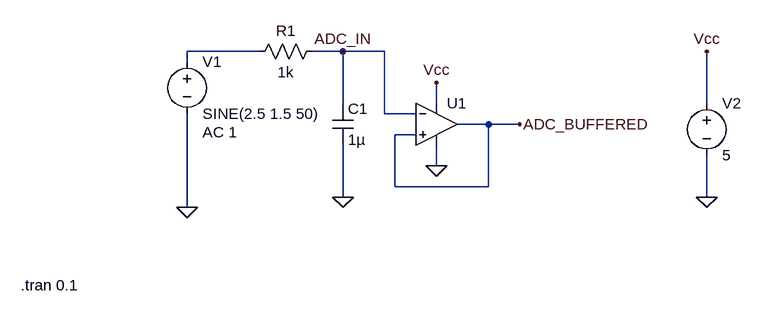
[diagram p0: schematic sensor_frontend.asc]
sensor_frontend.asc, the LTspice schematic file:
Version 4.1
SHEET 1 880 680
WIRE 112 64 0 64
WIRE 240 64 192 64
WIRE 304 64 240 64
WIRE 0 80 0 64
WIRE 240 144 240 64
WIRE 384 144 384 112
WIRE 800 144 800 64
WIRE 304 160 304 64
WIRE 352 160 304 160
WIRE 464 176 416 176
WIRE 512 176 464 176
WIRE 352 192 320 192
WIRE 384 240 384 208
WIRE 320 272 320 192
WIRE 464 272 464 176
WIRE 464 272 320 272
WIRE 240 288 240 208
WIRE 800 288 800 224
WIRE 0 304 0 160
FLAG 0 304 0
FLAG 240 288 0
FLAG 240 64 ADC_IN
FLAG 512 176 ADC_BUFFERED
FLAG 800 288 0
FLAG 800 64 Vcc
FLAG 384 112 Vcc
FLAG 384 240 0
SYMBOL res 208 48 R90
WINDOW 0 0 56 VBottom 2
WINDOW 3 32 56 VTop 2
SYMATTR InstName R1
SYMATTR Value 1k
SYMBOL cap 224 144 R0
SYMATTR InstName C1
SYMATTR Value 1µ
SYMBOL voltage 0 64 R0
WINDOW 123 24 124 Left 2
WINDOW 39 0 0 Left 0
SYMATTR Value2 AC 1
SYMATTR InstName V1
SYMATTR Value SINE(2.5 1.5 50)
SYMBOL OpAmps\\UniversalOpAmp2 384 176 R0
SYMATTR InstName U1
SYMBOL voltage 800 128 R0
WINDOW 123 0 0 Left 0
WINDOW 39 0 0 Left 0
SYMATTR InstName V2
SYMATTR Value 5
TEXT -256 424 Left 2 !.tran 0.1

The netlist it stands for:
* sensor_frontend.asc
R1 ADC_IN N001 1k
C1 ADC_IN 0 1µ
V1 N001 0 SINE(2.5 1.5 50) AC 1
X§U1 ADC_BUFFERED ADC_IN Vcc 0 ADC_BUFFERED level2 Avol=1Meg GBW=10Meg Slew=10Meg Ilimit=25m Rail=0 Vos=0 En=0 Enk=0 In=0 Ink=0 Rin=500Meg  ; pins In+ In- V+ V- OUT
V2 Vcc 0 5
.tran 0.1
.lib UniversalOpAmp2.lib
.backanno
.end